# Altium schematic sheet esp8266.SchDoc
size A; SheetNumber: 6; SheetTotal: 9
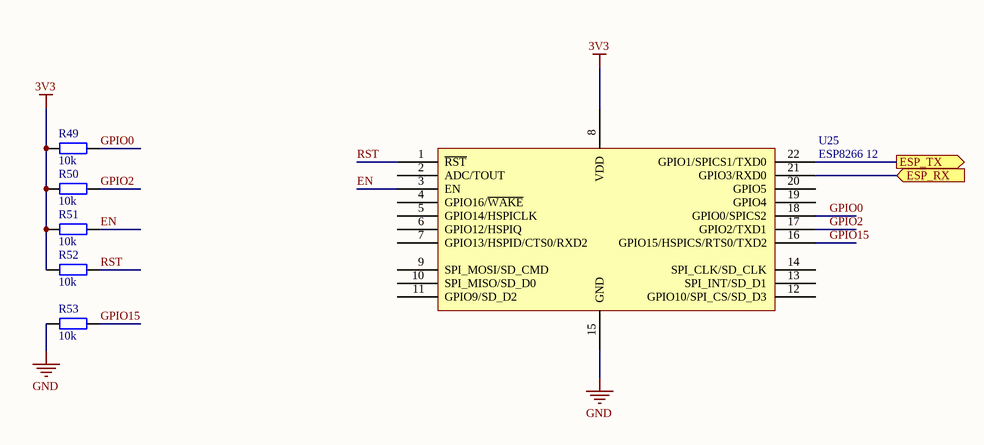
[diagram p0: esp8266.SchDoc]

## Parts
R49  10k  [tro smd 0805]
R50  10k  [tro smd 0805]
R51  10k  [tro smd 0805]
R52  10k  [tro smd 0805]
R53  10k  [tro smd 0805]
U25  ESP8266 12  [ESP8266 12]

## Ports
ESP_RX (in), ESP_TX (out)

## Nets
3V3: R49.1 R50.1 R51.1 R52.1 U25.8(VDD)
GND: R53.1 U25.15(GND)
EN: R51.2 U25.3(EN)
ESP_RX: U25.21(GPIO3/RXD0) ; port ESP_RX
ESP_TX: U25.22(GPIO1/SPICS1/TXD0) ; port ESP_TX
GPIO0: R49.2 U25.18(GPIO0/SPICS2)
GPIO2: R50.2 U25.17(GPIO2/TXD1)
GPIO15: R53.2 U25.16(GPIO15/HSPICS/RTS0/TXD2)
RST: R52.2 U25.1(~{RST})

Not connected (* = marked no-connect by the designer): U25 2(ADC/TOUT) 4(GPIO16/~{WAKE}) 5(GPIO14/HSPICLK) 6(GPIO12/HSPIQ) 7(GPIO13/HSPID/CTS0/RXD2) 9(SPI_MOSI/SD_CMD) 10(SPI_MISO/SD_D0) 11(GPIO9/SD_D2) 12(GPIO10/SPI_CS/SD_D3) 13(SPI_INT/SD_D1) 14(SPI_CLK/SD_CLK) 19(GPIO4) 20(GPIO5)

## Library data of the parts
R49-R53 = Tro 0805 1% 10k: Dán; Don_Vi: Con; So_Chan: 2; Ten_Linh_Kien: Trở 0805 1% 10k; Ma_Hang: MH005473; Chung_Loai: Dán; Kieu_Chan: *
U25 = ESP8266 12: ESP8266 12 22 Pin; IC: ESP8266-EX; Vendor: Ai-thinker